# EAGLE design zatana_pcb_esp32 (EAGLE 9.6.2)
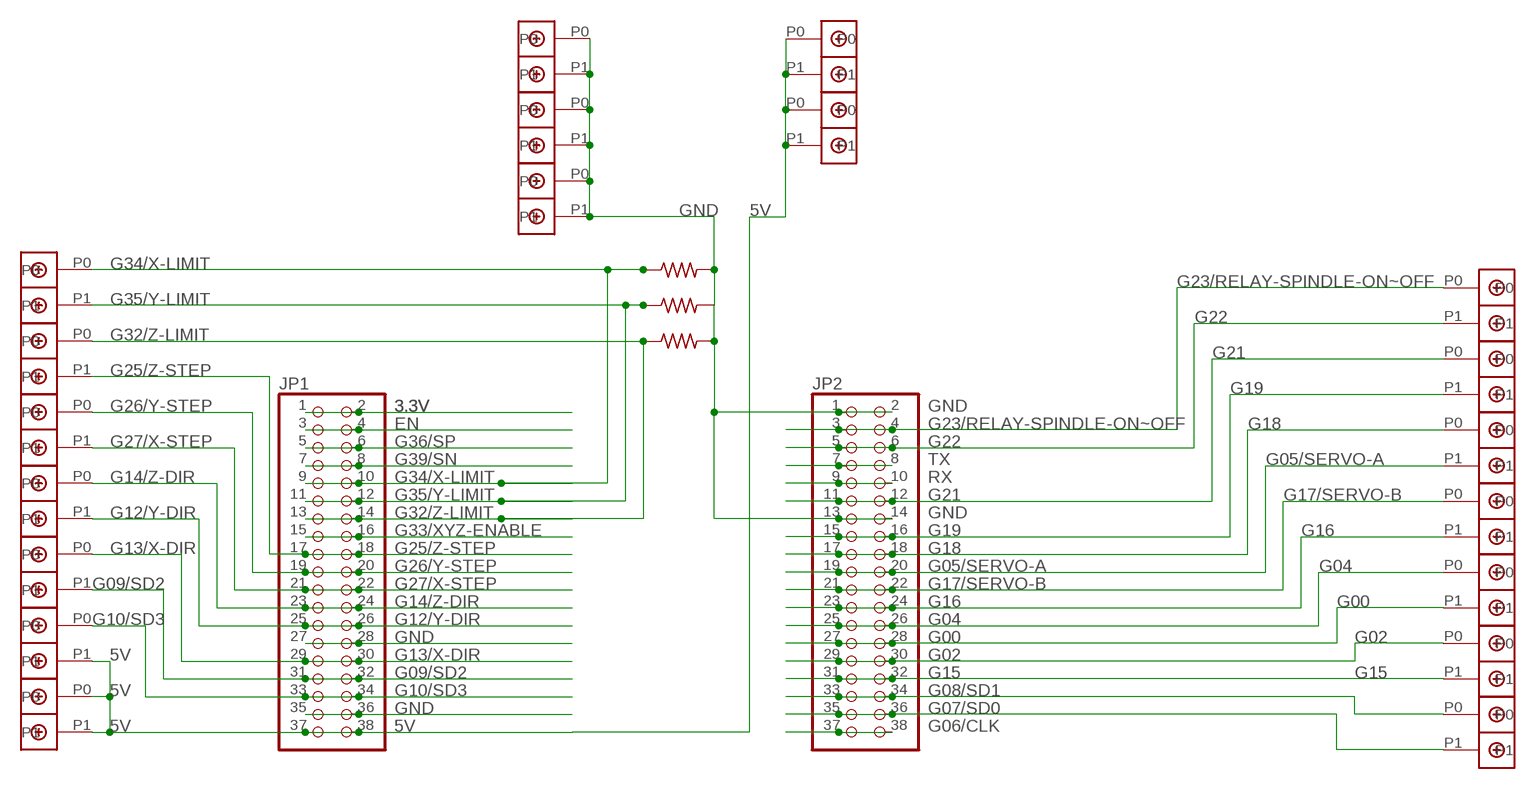
[diagram p0: schematic, sheet 1]

## Parts
JP1  PINHD-2X19_2.54-90°  [2X19/90]
JP2  PINHD-2X19_2.54-90°  [2X19/90]
R1  R-US_0207/10  [0207/10]
R2  R-US_0207/10  [0207/10]
R3  R-US_0207/10  [0207/10]
U$2  DBCONN-1X2  [DBCONN-1X2]
U$3  DBCONN-1X2  [DBCONN-1X2]
U$4  DBCONN-1X2  [DBCONN-1X2]
U$5  DBCONN-1X2  [DBCONN-1X2]
U$6  DBCONN-1X2  [DBCONN-1X2]
U$7  DBCONN-1X2  [DBCONN-1X2]
U$8  DBCONN-1X2  [DBCONN-1X2]
U$9  DBCONN-1X2  [DBCONN-1X2]
U$10  DBCONN-1X2  [DBCONN-1X2]
U$11  DBCONN-1X2  [DBCONN-1X2]
U$12  DBCONN-1X2  [DBCONN-1X2]
U$13  DBCONN-1X2  [DBCONN-1X2]
U$14  DBCONN-1X2  [DBCONN-1X2]
U$15  DBCONN-1X2  [DBCONN-1X2]
U$16  DBCONN-1X2  [DBCONN-1X2]
U$18  DBCONN-1X2  [DBCONN-1X2]
U$19  DBCONN-1X2  [DBCONN-1X2]
U$20  DBCONN-1X2  [DBCONN-1X2]
U$21  DBCONN-1X2  [DBCONN-1X2]

## Nets
3.3V: JP1.1 JP1.2
5V: JP1.37 JP1.38 U$7.P1 U$8.P0 U$8.P1 U$18.P0 U$18.P1 U$19.P0 U$19.P1
EN: JP1.3 JP1.4
G00: JP2.27 JP2.28 U$11.P1
G02: JP2.29 JP2.30 U$12.P0
G04: JP2.25 JP2.26 U$11.P0
G05/SERVO-A: JP2.19 JP2.20 U$9.P1
G06/CLK: JP2.37 JP2.38
G07/SD0: JP2.35 JP2.36 U$13.P1
G08/SD1: JP2.33 JP2.34 U$13.P0
G09/SD2: JP1.31 JP1.32 U$6.P1
G10/SD3: JP1.33 JP1.34 U$7.P0
G12/Y-DIR: JP1.25 JP1.26 U$5.P1
G13/X-DIR: JP1.29 JP1.30 U$6.P0
G14/Z-DIR: JP1.23 JP1.24 U$5.P0
G15: JP2.31 JP2.32 U$12.P1
G16: JP2.23 JP2.24 U$10.P1
G17/SERVO-B: JP2.21 JP2.22 U$10.P0
G18: JP2.17 JP2.18 U$9.P0
G19: JP2.15 JP2.16 U$20.P1
G21: JP2.11 JP2.12 U$20.P0
G22: JP2.5 JP2.6 U$21.P1
G23/RELAY-SPINDLE-ON~OFF: JP2.3 JP2.4 U$21.P0
G25/Z-STEP: JP1.17 JP1.18 U$2.P1
G26/Y-STEP: JP1.19 JP1.20 U$4.P0
G27/X-STEP: JP1.21 JP1.22 U$4.P1
G32/Z-LIMIT: JP1.13 JP1.14 R3.1 U$2.P0
G33/XYZ-ENABLE: JP1.15 JP1.16
G34/X-LIMIT: JP1.9 JP1.10 R1.1 U$3.P0
G35/Y-LIMIT: JP1.11 JP1.12 R2.1 U$3.P1
G36/SP: JP1.5 JP1.6
G39/SN: JP1.7 JP1.8
GND: JP1.27 JP1.28 JP1.35 JP1.36 JP2.1 JP2.2 JP2.13 JP2.14 R1.2 R2.2 R3.2 U$14.P0 U$14.P1 U$15.P0 U$15.P1 U$16.P0 U$16.P1
RX: JP2.9 JP2.10
TX: JP2.7 JP2.8

## Library data of the parts
JP1 JP2 = pinhead-2:PINHD-2X19: PIN HEADER
R1-R3 = resistor:R-US_: RESISTOR, American symbol
U$2-U$16 U$18-U$21 = Terminal Block Connector:DBCONN-1X2

## Board
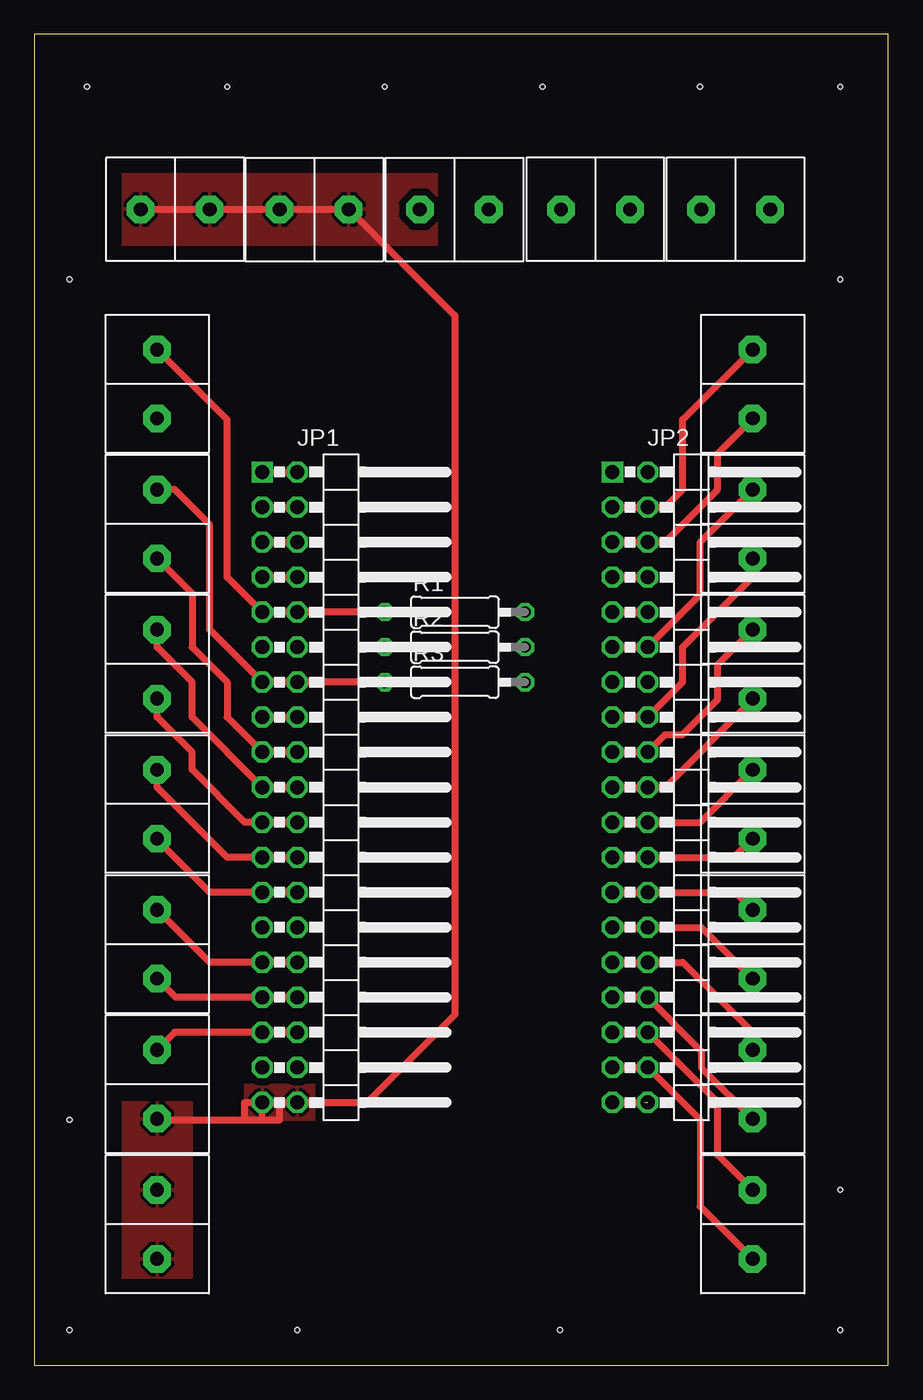
[diagram p1: board, top side]
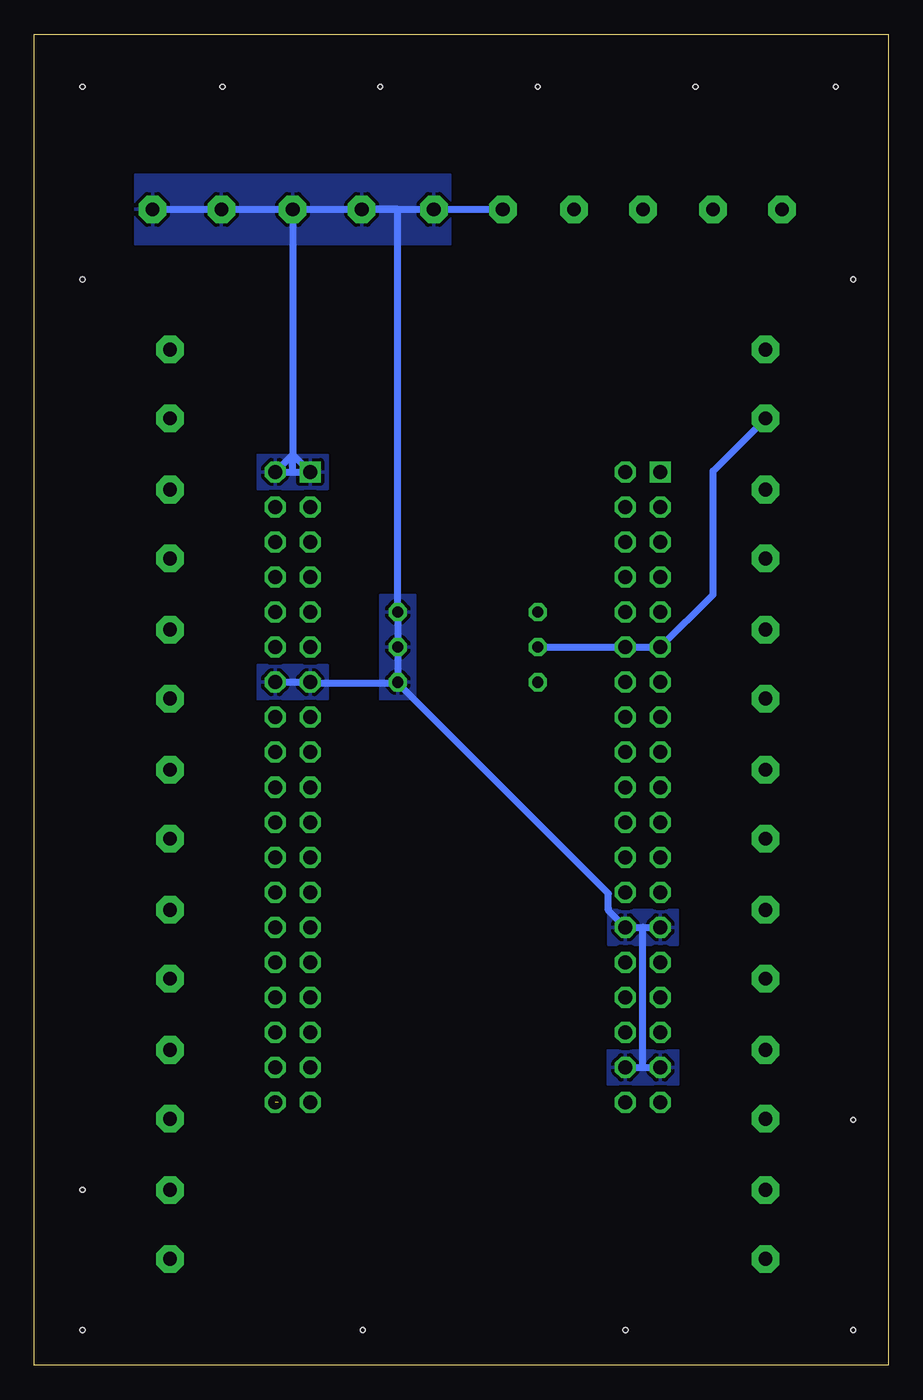
[diagram p2: board, bottom side, seen from below]

Size 61.9 x 96.51 mm. Coordinates in mm from the lower left corner, seen from the top.
Outline: 0,0 61.9,0 61.9,96.51 0,96.51 0,0
Copper layers (1*16): Top 0.035mm / dielectric 1.5mm / Bottom 0.035mm
Design rules "default *": minimum track width 15mil, minimum drill 0.5mm, track to track 6mil, track to pad 6mil, pad to pad 6mil, via to via 6mil, smd to smd 6mil, copper to edge 40mil, drill to drill 6mil, minimum pad ring 10mil, minimum via ring 10mil, stop-mask expansion 30mil, vias tented up to drill 0mil, thermal gap 10mil
Holes 0.35 mm at 3.81,92.71 58.42,92.71 48.26,92.71 36.83,92.71 25.4,92.71 13.97,92.71 2.54,2.54 19.05,2.54 38.1,2.54 58.42,2.54 58.42,78.74 2.54,17.78 2.54,78.74 58.42,12.7

### Footprints (pad centres in the part's own frame; a part is rotated, then mirrored left to right if it is on the bottom)
2X19/90 = drill 1.016 square: 1 -22.86,-6.35 | drill 1.016 octagon: 2 -22.86,-3.81; 3 -20.32,-6.35; 4 -20.32,-3.81; 5 -17.78,-6.35; 6 -17.78,-3.81; 7 -15.24,-6.35; 8 -15.24,-3.81; 9 -12.7,-6.35; 10 -12.7,-3.81; 11 -10.16,-6.35; 12 -10.16,-3.81; 13 -7.62,-6.35; 14 -7.62,-3.81; 15 -5.08,-6.35; 16 -5.08,-3.81; 17 -2.54,-6.35; 18 -2.54,-3.81; 19 0,-6.35; 20 0,-3.81; 21 2.54,-6.35; 22 2.54,-3.81; 23 5.08,-6.35; 24 5.08,-3.81; 25 7.62,-6.35; 26 7.62,-3.81; 27 10.16,-6.35; 28 10.16,-3.81; 29 12.7,-6.35; 30 12.7,-3.81; 31 15.24,-6.35; 32 15.24,-3.81; 33 17.78,-6.35; 34 17.78,-3.81; 35 20.32,-6.35; 36 20.32,-3.81; 37 22.86,-6.35; 38 22.86,-3.81
0207/10 = drill 0.813 octagon: 1 -5.08,0; 2 5.08,0
DBCONN-1X2 = drill 1 pad 2 octagon: P0 -2.54,0; P1 2.46,0

### Placement (x,y rotation side)
JP1  22.86,41.91 270 top
JP2  48.26,41.91 270 top
R1  30.48,54.61 0 top
R2  30.48,52.07 0 top
R3  30.48,49.53 0 top
U$2  8.89,60.96 270 top
U$3  8.89,71.12 270 top
U$4  8.89,50.8 270 top
U$5  8.89,40.64 270 top
U$6  8.89,30.48 270 top
U$7  8.89,20.32 270 top
U$8  8.89,10.16 270 top
U$9  52.07,50.8 270 top
U$10  52.07,40.64 270 top
U$11  52.07,30.48 270 top
U$12  52.07,20.32 270 top
U$13  52.07,10.16 270 top
U$14  50.8,83.82 180 top
U$15  40.64,83.82 180 top
U$16  30.48,83.82 0 top
U$18  10.16,83.82 180 top
U$19  20.32,83.82 0 top
U$20  52.07,60.96 270 top
U$21  52.07,71.12 270 top

### Tracks (layer width: path | path; a pad name or v marks a point on that pad's centre or on a via)
3.3V
  Top 0.508: JP1.1 JP1.2
5V
  Top 0.508: U$7.P1 8.97,17.78 15.24,17.78 | 15.24,17.78 16.51,17.78 | 16.51,17.78 17.78,17.78 17.78,19.05 | 16.51,17.78 JP1.37 | 15.24,17.78 15.24,19.05 JP1.37 | 17.78,19.05 JP1.38 24.13,19.05 30.48,25.4 30.48,76.12 U$19.P1 U$19.P0 U$18.P0 U$18.P1 | JP1.37 17.78,19.05
  pour Top (isolate 0.508): 29.21,86.36 6.35,86.36 6.35,81.28 29.21,81.28
  pour Top (isolate 0.508): 11.43,19.05 6.35,19.05 6.35,6.35 11.43,6.35
  pour Top (isolate 0.508): 20.32,20.32 15.24,20.32 15.24,17.78 20.32,17.78
EN
  Top 0.508: JP1.3 JP1.4
G00
  Top 0.508: JP2.27 JP2.28 48.34,31.75 U$11.P1
G02
  Top 0.508: JP2.29 JP2.30 46.99,29.21 52.07,24.13 U$12.P0
G04
  Top 0.508: JP2.25 JP2.26 50.8,34.29 U$11.P0
G05/SERVO-A
  Top 0.508: JP2.19 JP2.20 45.72,41.91 52.07,48.26 U$9.P1
G06/CLK  (1 unrouted)
  Top 0.508: JP2.37 44.23,19.05
G07/SD0
  Top 0.508: JP2.35 JP2.36 48.26,17.78 48.26,11.51 U$13.P1
G08/SD1
  Top 0.508: JP2.33 JP2.34 49.53,19.05 49.53,15.24 U$13.P0
G09/SD2
  Top 0.508: JP1.32 JP1.31 10.24,26.67 U$6.P1
G10/SD3
  Top 0.508: JP1.34 JP1.33 10.16,24.13 U$7.P0
G12/Y-DIR
  Top 0.508: JP1.26 JP1.25 12.7,34.29 8.89,38.1 U$5.P1
G13/X-DIR
  Top 0.508: JP1.30 JP1.29 12.7,29.21 U$6.P0
G14/Z-DIR
  Top 0.508: JP1.24 JP1.23 13.97,36.83 8.89,41.91 U$5.P0
G15
  Top 0.508: JP2.31 JP2.32 48.36,22.76 48.36,21.57 U$12.P1
G16
  Top 0.508: JP2.23 JP2.24 50.72,36.83 U$10.P1
G17/SERVO-B
  Top 0.508: JP2.21 JP2.22 48.26,39.37 U$10.P0
G18
  Top 0.508: JP2.17 JP2.18 45.72,45.72 46.99,45.72 49.53,48.26 49.53,50.8 U$9.P0
G19
  Top 0.508: JP2.15 JP2.16 46.99,49.53 46.99,52.07 52.07,57.15 U$20.P1
G21
  Top 0.508: JP2.11 JP2.12 48.26,55.88 48.26,59.69 U$20.P0
G22
  Top 0.508: JP2.5 JP2.6 45.72,59.69 49.53,63.5 49.53,66.12 U$21.P1
G23/RELAY-SPINDLE-ON~OFF
  Top 0.508: JP2.3 JP2.4 45.72,62.23 46.99,63.5 46.99,68.58 U$21.P0
G25/Z-STEP
  Top 0.508: JP1.18 JP1.17 13.97,46.99 13.97,49.53 11.43,52.07 11.43,55.96 U$2.P1
G26/Y-STEP
  Top 0.508: JP1.20 JP1.19 11.43,46.99 11.43,49.53 8.89,52.07 U$4.P0
G27/X-STEP
  Top 0.508: JP1.22 JP1.21 15.24,39.37 11.43,43.18 11.43,44.45 8.89,46.99 U$4.P1
G32/Z-LIMIT
  Top 0.508: R3.1 JP1.14 JP1.13 12.7,53.34 12.7,60.96 10.16,63.5 U$2.P0
G33/XYZ-ENABLE
  Top 0.381: 16.55,47 JP1.15
  Top 0.508: JP1.15 JP1.16
G34/X-LIMIT
  Top 0.508: R1.1 JP1.10 JP1.9 13.97,57.15 13.97,68.58 U$3.P0
G35/Y-LIMIT
  Bottom 0.508: R2.1 JP1.12 JP1.11 12.7,55.88 12.7,64.85 U$3.P1
G36/SP
  Top 0.508: JP1.5 JP1.6
G39/SN
  Top 0.508: JP1.7 JP1.8
GND
  Bottom 0.381: 20.28,33.13 20.32,33.02
  Bottom 0.508: 20.28,33.13 20.28,34.2 35.56,49.48 | 35.56,49.48 R3.2 R2.2 R1.2 35.56,83.82 | 35.56,49.48 41.86,49.48 JP2.13 JP2.14 | 35.56,83.82 U$16.P1 | 35.56,83.82 U$15.P1 | U$15.P0 43.18,66.04 | 43.18,64.77 43.18,66.04 | 43.18,64.77 JP2.1 43.18,66.04 | 43.18,64.77 JP2.2 43.18,66.04 | U$14.P0 U$14.P1 U$15.P0 | U$15.P0 U$15.P1 | U$15.P1 U$16.P1 | U$16.P1 U$16.P0 | 20.32,33.02 JP1.28 17.78,31.75 | 17.78,31.75 JP1.27 | JP1.36 17.78,21.59 | 17.78,21.59 JP1.35 | 17.78,21.59 17.78,31.75
  pour Bottom (isolate 0.508): 54.61,86.36 31.75,86.36 31.75,81.28 54.61,81.28
  pour Bottom (isolate 0.508): 44.45,66.04 40.64,66.04 40.64,63.5 45.72,63.5 45.72,66.04
  pour Bottom (isolate 0.508): 36.83,55.88 34.29,55.88 34.29,48.26 36.83,48.26
  pour Bottom (isolate 0.508): 15.24,33.02 20.32,33.02 20.32,30.48 15.24,30.48
  pour Bottom (isolate 0.508): 20.32,22.86 15.24,22.86 15.24,20.32 20.32,20.32
  pour Bottom (isolate 0.508): 45.72,50.8 40.64,50.8 40.64,48.26 45.72,48.26
RX
  Top 0.508: JP2.9 JP2.10
TX
  Top 0.508: JP2.7 JP2.8